# EasyEDA Pro project PLOTUS_ESP32S3_revA_project.epro

# Schematic Schematic1
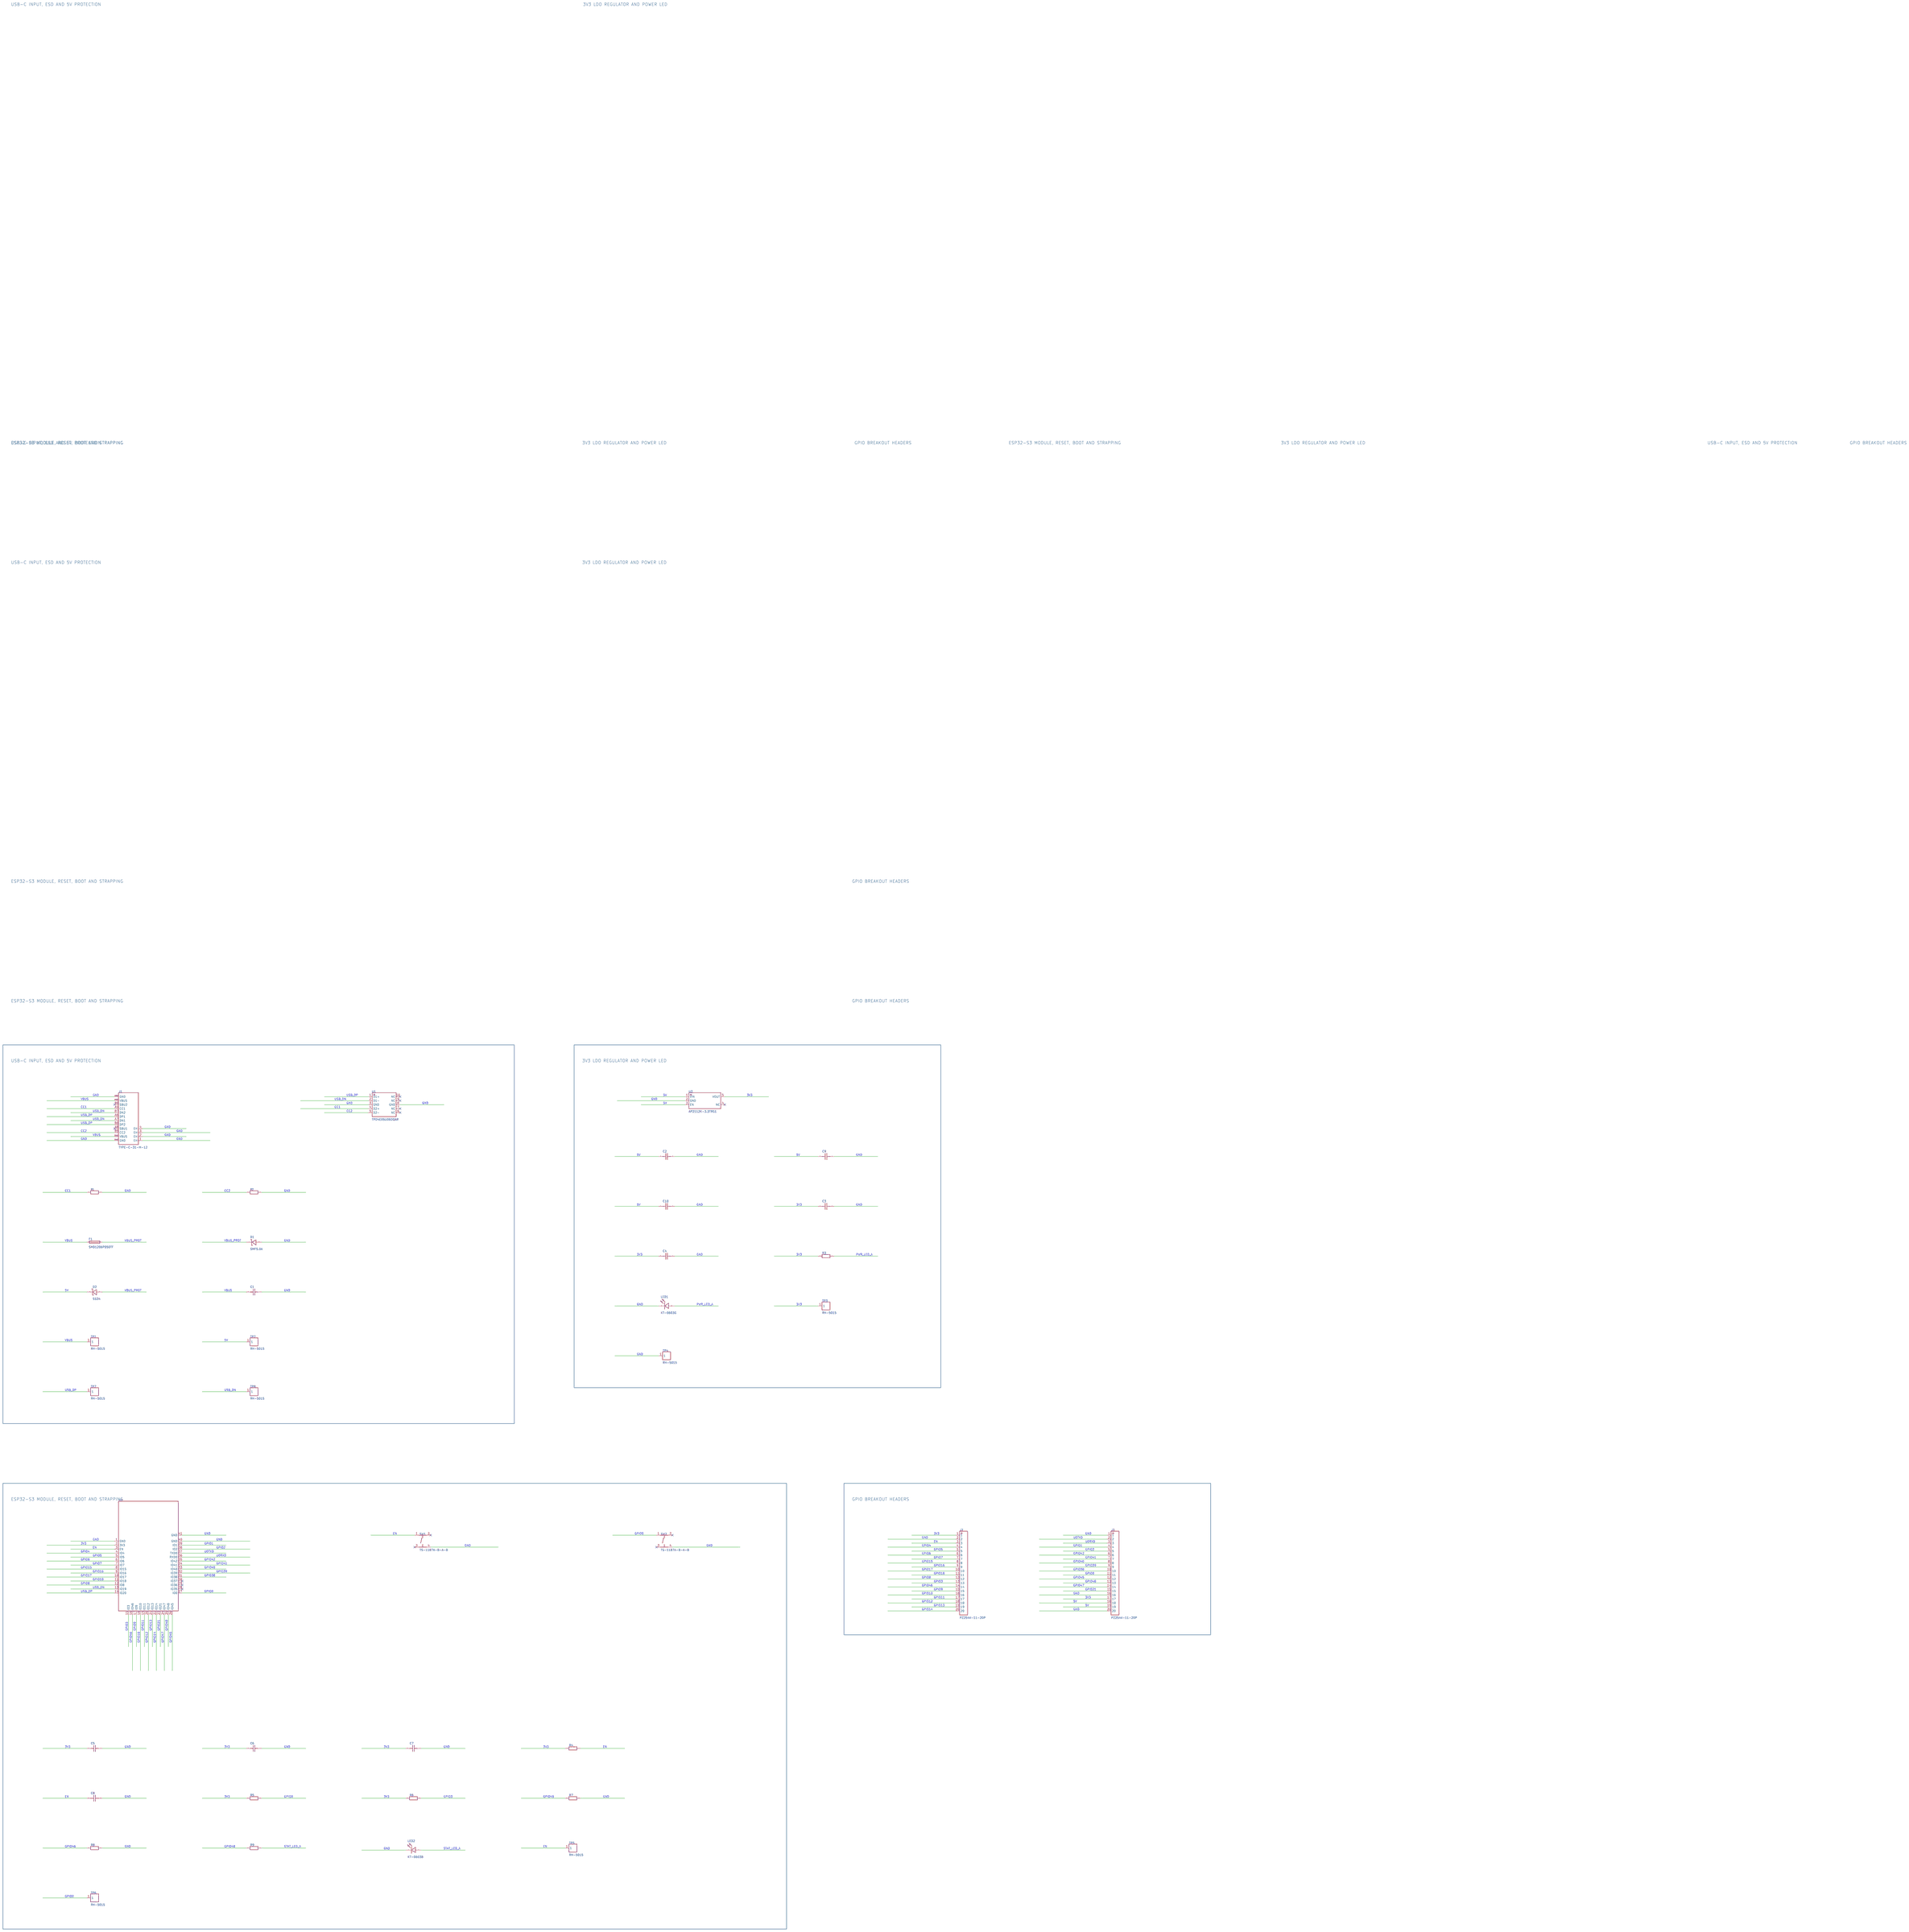
[diagram p0: schematic sheet]

## Parts
C1  100nF  [C0402]
C2  10uF  [C0603]
C3  10uF  [C0603]
C4  100nF  [C0402]
C5  10uF  [C0603]
C6  1uF  [C0402]
C7  100nF  [C0402]
C8  1uF  [C0402]
C9  1uF  [C0402]
C10  100nF  [C0402]
D1  SMF5.0A  [SOD-123_L2.8-W1.8-LS3.7-RD]
D2  SS34  [SMA_L4.3-W2.6-LS5.2-RD]
F1  SMD1206P050TF  [F1206]
J1  TYPE-C-31-M-12  [USB-C_SMD-TYPE-C-31-M-12_1]
J2  PZ254V-11-20P  [HDR-TH_20P-P2.54-V-M-4]
J3  PZ254V-11-20P  [HDR-TH_20P-P2.54-V-M-4]
LED1  KT-0603G  [LED0603-RD]
LED2  KT-0603B  [LED0603-RD]
R1  5.1kΩ  [R0402]
R2  5.1kΩ  [R0402]
R3  1kΩ  [R0402]
R4  10kΩ  [R0402]
R5  10kΩ  [R0402]
R6  10kΩ  [R0402]
R7  10kΩ  [R0402]
R8  10kΩ  [R0402]
R9  1kΩ  [R0402]
SW1  TS-1187A-B-A-B  [SW-SMD_4P-L5.1-W5.1-P3.70-LS6.5-TL_H1.5]
SW2  TS-1187A-B-A-B  [SW-SMD_4P-L5.1-W5.1-P3.70-LS6.5-TL_H1.5]
TP1  RH-5015  [SMD_RH-5015]
TP2  RH-5015  [SMD_RH-5015]
TP3  RH-5015  [SMD_RH-5015]
TP4  RH-5015  [SMD_RH-5015]
TP5  RH-5015  [SMD_RH-5015]
TP6  RH-5015  [SMD_RH-5015]
TP7  RH-5015  [SMD_RH-5015]
TP8  RH-5015  [SMD_RH-5015]
U1  TPD4E05U06DQAR  [USON-10_L2.5-W1.0-P0.50-BL]
U2  AP2112K-3.3TRG1  [SOT-25-5_L2.9-W1.6-P0.95-LS2.8-BL]
U3  2.4GHz  [WIRELM-SMD_ESP32-S3-WROOM-1]

## Library data of the parts
C1 C4 C7 C10 = CL05B104KO5NNNC: Capacitance:100nF Tolerance:±10% Tolerance:±10% Voltage Rating:16V Temperature Coefficient:X7R; LCSC Part Name: 100nF ±10% 16V; Supplier Part: CL05B104KO5NNNC.1; Manufacturer: SAMSUNG(三星); Supplier Footprint: 0402; JLCPCB Part Class: Basic Part; Datasheet: https://item.szlcsc.com/datasheet/CL05B104KO5NNNC/1877.html; Supplier: LCSC; Tolerance: ±10%; Voltage Rating: 16V; Temperature Coefficient: X7R
C2 C3 C5 = CL10A106KP8NNNC: Capacitance:10uF Tolerance:±10% Tolerance:±10% Voltage Rating:10V Temperature Coefficient:X5R; LCSC Part Name: 10uF ±10% 10V; Supplier Part: CL10A106KP8NNNC.1; Manufacturer: SAMSUNG(三星); Supplier Footprint: 0603; JLCPCB Part Class: Basic Part; Datasheet: https://item.szlcsc.com/datasheet/CL10A106KP8NNNC/20411.html; Supplier: LCSC; Tolerance: ±10%; Voltage Rating: 10V; Temperature Coefficient: X5R
C6 C8 C9 = CL05A105KA5NQNC: Capacitance:1uF Tolerance:±10% Tolerance:±10% Voltage Rating:25V Temperature Coefficient:X5R; LCSC Part Name: 1uF ±10% 25V; Supplier Part: CL05A105KA5NQNC.1; Manufacturer: SAMSUNG(三星); Supplier Footprint: 0402; JLCPCB Part Class: Basic Part; Datasheet: https://item.szlcsc.com/datasheet/CL05A105KA5NQNC/53938.html; Supplier: LCSC; Tolerance: ±10%; Voltage Rating: 25V; Temperature Coefficient: X5R
D1 = SMF5.0A: Reverse Stand-Off Voltage (Vrwm):5V Maximum Clamping Voltage:9.2V Peak Pulse Current (Ipp)@10/1000us:21.7A Breakdown Voltage:6.4V Type:TVS; Supplier Part: SMF5.0A.1; Supplier Footprint: SOD-123; JLCPCB Part Class: Extended Part; Datasheet: https://atta.szlcsc.com/upload/public/pdf/source/20180528/C132591_2E6627FA8E0A601785D44BCCBB8E552F.pdf; Supplier: LCSC; Reverse Stand-Off Voltage (Vrwm): 5V; Maximum Clamping Voltage: 9.2V; Peak Pulse Current (Ipp)@10/1000us: 21.7A; Breakdown Voltage: 6.4V; Type: TVS
D2 = SS34_C8678: Diode Configuration:Standalone Voltage - Forward(Vf@If):550mV@3A Voltage - DC Reverse(Vr):40V Current - Rectified:3A Reverse Leakage Current (Ir):500uA@40V Operating Junction Temperature Range:-55℃~+125℃ Operating Junction Temperature Range:-55℃~+125℃ Non; LCSC Part Name: 电压:40V 电流:3A; Supplier Part: SS34_C8678.1; Manufacturer: MDD(辰达半导体); Supplier Footprint: SMA(DO-214AC); JLCPCB Part Class: Basic Part; Datasheet: https://item.szlcsc.com/datasheet/SS34/9178.html; Supplier: LCSC; Diode Configuration: Standalone; Voltage - Forward(Vf@If): 550mV@3A; Voltage - DC Reverse(Vr): 40V; Current - Rectified: 3A; Reverse Leakage Current (Ir): 500uA@40V; Operating Junction Temperature Range: -55℃~+125℃; Non-Repetitive Peak Forward Surge Current: 80A
F1 = SMD1206P050TF: Operating Voltage (Max):6V Current Rating (Max):100A Hold Current:500mA Trip Current:1A; LCSC Part Name: 6V 500mA 1206自恢复; Supplier Part: SMD1206P050TF_C146251.1; Supplier Footprint: 1206; JLCPCB Part Class: Extended Part; Datasheet: https://atta.szlcsc.com/upload/public/pdf/source/20190516/C393936_420B0FABA34AF599CC1FFF27153B6079.pdf; Supplier: LCSC; Operating Voltage (Max): 6V; Current Rating (Max): 100A; Hold Current: 500mA; Trip Current: 1A
J1 = TYPE-C-31-M-12: Connector Type:Type-C Protocol Standard:- Gender:Female Mounting Type:Surface Mount, Right Angle Number of Contacts:16P Number of Ports:1 Current Rating-Power:5A Voltage Rating:20V Connect-Disconnect Life:10,000 cycles Length:7.35mm Operating Temperature:; LCSC Part Name: Type-C 母 卧贴; Supplier Part: TYPE-C-31-M-12.1; Manufacturer: 韩国韩荣; Supplier Footprint: SMD; JLCPCB Part Class: Extended Part; Datasheet: https://item.szlcsc.com/datasheet/TYPE-C-31-M-12/177331.html; Supplier: LCSC; Connector Type: Type-C; Gender: Female; Mounting Type: Surface Mount, Right Angle; Number of Contacts: 16P; Number of Ports: 1; Current Rating-Power: 5A; Voltage Rating: 20V; Connect-Disconnect Life: 10,000 cycles; Length: 7.35mm; Operating Temperature: -30℃~+80℃
J2 J3 = PZ254V-11-20P: Pin Structure:1x20P Pitch:2.54mm Circluar Pins/Square Pins:Pin Header Mounting Type:Through Hole Number of Rows:1 Number of Pins:20P Current Rating:3A Length of Mating Pin:6.1mm Insulation Height:2.5mm Length of End Connection Pin:3mm Contact Material:Bra; LCSC Part Name: 1x20P 间距:2.54mm 方针 直插; Supplier Part: PZ254V-11-20P.1; Manufacturer: XFCN(兴飞); Supplier Footprint: 插件,P=2.54mm; JLCPCB Part Class: Extended Part; Datasheet: https://item.szlcsc.com/datasheet/PZ254V-11-20P/24163072.html; Supplier: LCSC; Pin Structure: 1x20P; Pitch: 2.54mm; Circluar Pins/Square Pins: Pin Header; Mounting Type: Through Hole; Number of Rows: 1; Number of Pins: 20P; Current Rating: 3A; Length of Mating Pin: 6.1mm; Insulation Height: 2.5mm; Length of End Connection Pin: 3mm; Contact Material: Brass; Operating Temperature: -40℃~+105℃; Color: Black
LED1 = KT-0603G: Lamp Holder Type:1.6mm x 0.8mm square LED Illumination Color:Emerald Green Voltage - Forward(Vf):3.1V Voltage - Forward(Vf):3.1V Power(Watts):100mW Forward Current:5mA Wavelength - Dominant:513nm~528nm Wavelength - Dominant:513nm~528nm Peak Wavelength:525; LCSC Part Name: 0603 翠绿 高亮; Supplier Part: 0603 Green 509-620mcd.1; Manufacturer: KENTO; Supplier Footprint: 0603; JLCPCB Part Class: Extended Part; Datasheet: https://item.szlcsc.com/datasheet/KT-0603G/13258.html; Supplier: LCSC; Lamp Holder Type: 1.6mm x 0.8mm square LED; Illumination Color: Emerald Green; Voltage - Forward(Vf): 3.1V; Power(Watts): 100mW; Forward Current: 5mA; Wavelength - Dominant: 513nm~528nm; Peak Wavelength: 525nm; Diode Configuration: Discrete Diode; Lens Color: Water Clear; Luminous Intensity: 430mcd; Viewing Angle: 120°; Operating Temperature: -40℃~+85℃
LED2 = KT-0603B: Lamp Holder Type:1.6mm x 0.8mm square LED Illumination Color:Blue Voltage - Forward(Vf):3.1V Voltage - Forward(Vf):3.1V Power(Watts):100mW Forward Current:5mA Wavelength - Dominant:460nm~475nm Wavelength - Dominant:460nm~475nm Peak Wavelength:469nm Peak W; LCSC Part Name: 0603 蓝灯 高亮; Supplier Part: Blue light 0603.1; Manufacturer: KENTO; Supplier Footprint: 0603; JLCPCB Part Class: Extended Part; Datasheet: https://item.szlcsc.com/datasheet/KT-0603B/2661.html; Supplier: LCSC; Lamp Holder Type: 1.6mm x 0.8mm square LED; Illumination Color: Blue; Voltage - Forward(Vf): 3.1V; Power(Watts): 100mW; Forward Current: 5mA; Wavelength - Dominant: 460nm~475nm; Peak Wavelength: 469nm; Diode Configuration: Discrete Diode; Lens Color: Water Clear; Luminous Intensity: 175mcd; Viewing Angle: 120°; Operating Temperature: -40℃~+85℃
R1 R2 = 0402WGF5101TCE: Type:Thick Film Resistor Resistance:5.1kΩ Tolerance:±1% Tolerance:±1% Power(Watts):62.5mW Voltage-Supply(Max):50V Temperature Coefficient:±100ppm/℃ Temperature Coefficient:±100ppm/℃ Operating Temperature:-55℃~+155℃ Operating Temperature:-55℃~+155℃; LCSC Part Name: 厚膜电阻 5.1kΩ ±1%; Supplier Part: 0402WGF5101TCE.1; Manufacturer: UNI-ROYAL(厚声); Supplier Footprint: 0402; JLCPCB Part Class: Basic Part; Datasheet: https://item.szlcsc.com/datasheet/0402WGF5101TCE/26648.html; Supplier: LCSC; Type: Thick Film Resistor; Tolerance: ±1%; Power(Watts): 62.5mW; Voltage-Supply(Max): 50V; Temperature Coefficient: ±100ppm/℃; Operating Temperature: -55℃~+155℃
R3 R9 = 0402WGF1001TCE: Type:Thick Film Resistor Resistance:1kΩ Tolerance:±1% Tolerance:±1% Power(Watts):62.5mW Voltage-Supply(Max):50V Temperature Coefficient:±100ppm/℃ Temperature Coefficient:±100ppm/℃ Operating Temperature:-55℃~+155℃ Operating Temperature:-55℃~+155℃; LCSC Part Name: 厚膜电阻 1kΩ ±1%; Supplier Part: 0402WGF1001TCE.1; Manufacturer: UNI-ROYAL(厚声); Supplier Footprint: 0402; JLCPCB Part Class: Basic Part; Datasheet: https://item.szlcsc.com/datasheet/0402WGF1001TCE/12256.html; Supplier: LCSC; Type: Thick Film Resistor; Tolerance: ±1%; Power(Watts): 62.5mW; Voltage-Supply(Max): 50V; Temperature Coefficient: ±100ppm/℃; Operating Temperature: -55℃~+155℃
R4-R8 = 0402WGF1002TCE: Type:Thick Film Resistor Resistance:10kΩ Tolerance:±1% Tolerance:±1% Power(Watts):62.5mW Voltage-Supply(Max):50V Temperature Coefficient:±100ppm/℃ Temperature Coefficient:±100ppm/℃ Operating Temperature:-55℃~+155℃ Operating Temperature:-55℃~+155℃; LCSC Part Name: 厚膜电阻 10kΩ ±1%; Supplier Part: 0402WGF1002TCE.1; Manufacturer: UNI-ROYAL(厚声); Supplier Footprint: 0402; JLCPCB Part Class: Basic Part; Datasheet: https://item.szlcsc.com/datasheet/0402WGF1002TCE/26487.html; Supplier: LCSC; Type: Thick Film Resistor; Tolerance: ±1%; Power(Watts): 62.5mW; Voltage-Supply(Max): 50V; Temperature Coefficient: ±100ppm/℃; Operating Temperature: -55℃~+155℃
SW1 SW2 = TS-1187A-B-A-B: Circuit:SPST Actuator Style:Round Button Operating Force:1.6N Mounting Type:Surface Mount,Vertical Length:5.1mm Width:5.1mm Switch Height:1.5mm with Bracket:Without Bracket Contact Current:50mA Voltage Rating:12V Actuator/Cap Color:Gold With Lamp:No Life:; LCSC Part Name: 5.1*5.1*1.5mm 立贴 轻触开关; Supplier Part: TS-1187A-B-A-B.1; Manufacturer: XKB Connection(中国星坤); Supplier Footprint: SMD-4P,5.1x5.1mm; JLCPCB Part Class: Basic Part; Datasheet: https://item.szlcsc.com/datasheet/TS-1187A-B-A-B/299976.html; Supplier: LCSC; Circuit: SPST; Actuator Style: Round Button; Operating Force: 1.6N; Mounting Type: Surface Mount,Vertical; Length: 5.1mm; Width: 5.1mm; Switch Height: 1.5mm; with Bracket: Without Bracket; Contact Current: 50mA; Voltage Rating: 12V; Actuator/Cap Color: Gold; With Lamp: No; Life: 100,000 cycles; Operating Temperature: -30℃~+85℃
TP1-TP8 = RH-5015: Connector Type:Ferrite Ring (SMD) Plastic Color:Non-Plastic Board Space (Diameter φ/ Length x Width):2.67mmx1.02mm; LCSC Part Name: PCB电路板测试点/测试针; Supplier Part: RH-5015.1; Manufacturer: 荣和; JLCPCB Part Class: Extended Part; Datasheet: https://item.szlcsc.com/datasheet/RH-5015/5885634.html; Supplier: LCSC; Connector Type: Ferrite Ring (SMD); Plastic Color: Non-Plastic; Board Space (Diameter φ/ Length x Width): 2.67mmx1.02mm
U1 = TPD4E05U06DQAR: Supplier Part: TPD4E05U06DQAR.1; Supplier Footprint: USON-10; JLCPCB Part Class: Extended Part; Supplier: LCSC
U2 = AP2112K-3.3TRG1: Output Configuration:Positive Voltage - Supply:6V Output Voltage:3.3V Output Voltage:3.3V Output Current:600mA Power Supply Rejection Ratio (PSRR):65dB@(1kHz) Voltage Dropout:250mV@(600mA) standby current:55uA Noise:50uVrms Features:Enable control；Short C; LCSC Part Name: 3.3V 600mA 6V; Supplier Part: AP2112K-3.3TRG1.1; Manufacturer: DIODES(美台); Supplier Footprint: SOT-25-5; JLCPCB Part Class: Extended Part; Datasheet: https://item.szlcsc.com/datasheet/AP2112K-3.3TRG1/52131.html; Supplier: LCSC; Output Configuration: Positive; Voltage - Supply: 6V; Output Voltage: 3.3V; Output Current: 600mA; Power Supply Rejection Ratio (PSRR): 65dB@(1kHz); Voltage Dropout: 250mV@(600mA); standby current: 55uA; Noise: 50uVrms; Features: Enable control；Short Circuit Protection；Output discharge；Over Current Protection；Thermal shutdown; Operating Temperature: -40℃~+85℃@(Ta); Output Type: Fixed; Number of Outputs: 1
U3 = ESP32-S3-WROOM-1-N16R8: Utilized IC / Part:ESP32-S3R8 Interface Type:I2C；GPIO；UART；SPI；USB；I2S Frequency:2.4GHz Antenna Type:On-board PCB Antenna Output Power:20.5dBm Output Power:20.5dBm Voltage - Supply:3V~3.6V Voltage - Supply:3V~3.6V Receive  Current:95mA Send  Current:355mA; LCSC Part Name: 不带固件 通用型Wi-Fi+低功耗蓝牙MCU模组; Supplier Part: ESP32-S3-WROOM-1(N16R8).1; Manufacturer: ESPRESSIF(乐鑫); Supplier Footprint: SMD,25.5x18mm; JLCPCB Part Class: Extended Part; Datasheet: https://item.szlcsc.com/datasheet/ESP32-S3-WROOM-1-N16R8/3198300.html; Supplier: LCSC; Utilized IC / Part: ESP32-S3R8; Interface Type: I2C；GPIO；UART；SPI；USB；I2S; Antenna Type: On-board PCB Antenna; Output Power: 20.5dBm; Voltage - Supply: 3V~3.6V; Receive  Current: 95mA; Send  Current: 355mA; Sensitivity: -103.5dBm; Operating Temperature: -40℃~+65℃

## Nets
3V3: C3.1 C4.1 C5.1 C6.1 C7.1 J2.1 J3.17 R3.1 R4.1 R5.1 R6.1 TP3.1 U2.5(VOUT) U3.2(3V3)
5V: C2.1 C9.1 C10.1 D2.1(K) J3.18 J3.19 TP2.1 U2.1(VIN) U2.3(EN)
GND: C1.2 C2.2 C3.2 C4.2 C5.2 C6.2 C7.2 C8.2 C9.2 C10.2 D1.2(A) J1.1(EH) J1.2(EH) J1.3(EH) J1.4(EH) J1.A1B12(GND) J1.B1A12(GND) J2.2 J3.1 J3.16 J3.20 LED1.1(K) LED2.1(K) R1.2 R2.2 R7.2 R8.2 SW1.4(D) SW2.4(D) TP4.1 U1.3(GND) U1.8(GND) U2.2(GND) U3.1(GND) U3.40(GND) U3.41(GND)
VBUS: C1.1 F1.1 J1.A4B9(VBUS) J1.B4A9(VBUS) TP1.1
VBUS_PROT: D1.1(K) D2.2(A) F1.2
CC1: J1.A5(CC1) R1.1 U1.4(D2+)
CC2: J1.B5(CC2) R2.1 U1.5(D2-)
EN: C8.1 J2.3 R4.2 SW1.1(A) TP5.1 U3.3(EN)
GPIO0: J3.11 R5.2 SW2.1(A) TP6.1 U3.27(IO0)
GPIO1: J3.4 U3.39(IO1)
GPIO2: J3.5 U3.38(IO2)
GPIO3: J2.13 R6.2 U3.15(IO3)
GPIO4: J2.4 U3.4(IO4)
GPIO5: J2.5 U3.5(IO5)
GPIO6: J2.6 U3.6(IO6)
GPIO7: J2.7 U3.7(IO7)
GPIO8: J2.12 U3.12(IO8)
GPIO9: J2.15 U3.17(IO9)
GPIO10: J2.16 U3.18(IO10)
GPIO11: J2.17 U3.19(IO11)
GPIO12: J2.18 U3.20(IO12)
GPIO13: J2.19 U3.21(IO13)
GPIO14: J2.20 U3.22(IO14)
GPIO15: J2.8 U3.8(IO15)
GPIO16: J2.9 U3.9(IO16)
GPIO17: J2.10 U3.10(IO17)
GPIO18: J2.11 U3.11(IO18)
GPIO21: J3.15 U3.23(IO21)
GPIO38: J3.10 U3.31(IO38)
GPIO39: J3.9 U3.32(IO39)
GPIO40: J3.8 U3.33(IO40)
GPIO41: J3.7 U3.34(IO41)
GPIO42: J3.6 U3.35(IO42)
GPIO45: J3.12 R7.1 U3.26(IO45)
GPIO46: J2.14 R8.1 U3.16(IO46)
GPIO47: J3.14 U3.24(IO47)
GPIO48: J3.13 R9.1 U3.25(IO48)
PWR_LED_A: LED1.2(A) R3.2
STAT_LED_A: LED2.2(A) R9.2
U0RXD: J3.3 U3.36(RXD0)
U0TXD: J3.2 U3.37(TXD0)
USB_DN: J1.A7(DN1) J1.B7(DN2) TP8.1 U1.2(D1-) U3.13(IO19)
USB_DP: J1.A6(DP1) J1.B6(DP2) TP7.1 U1.1(D1+) U3.14(IO20)

Not connected (* = marked no-connect by the designer): J1 A8(SBU1)* B8(SBU2)*; SW1 2(B)* 3(C)*; SW2 2(B)* 3(C)*; U1 6(NC)* 7(NC)* 9(NC)* 10(NC)*; U2 4(NC)*; U3 28(IO35)* 29(IO36)* 30(IO37)*

## Notes on the sheet
- USB-C INPUT, ESD AND 5V PROTECTION
- 3V3 LDO REGULATOR AND POWER LED
- ESP32-S3 MODULE, RESET, BOOT AND STRAPPING
- ESP32-S3 MODULE, RESET, BOOT AND STRAPPING
- USB-C INPUT, ESD AND 5V PROTECTION
- 3V3 LDO REGULATOR AND POWER LED
- GPIO BREAKOUT HEADERS
- ESP32-S3 MODULE, RESET, BOOT AND STRAPPING
- 3V3 LDO REGULATOR AND POWER LED
- USB-C INPUT, ESD AND 5V PROTECTION
- GPIO BREAKOUT HEADERS
- USB-C INPUT, ESD AND 5V PROTECTION
- 3V3 LDO REGULATOR AND POWER LED
- ESP32-S3 MODULE, RESET, BOOT AND STRAPPING
- GPIO BREAKOUT HEADERS
- ESP32-S3 MODULE, RESET, BOOT AND STRAPPING
- GPIO BREAKOUT HEADERS
- USB-C INPUT, ESD AND 5V PROTECTION
- 3V3 LDO REGULATOR AND POWER LED
- ESP32-S3 MODULE, RESET, BOOT AND STRAPPING
- GPIO BREAKOUT HEADERS

# Board PCB1
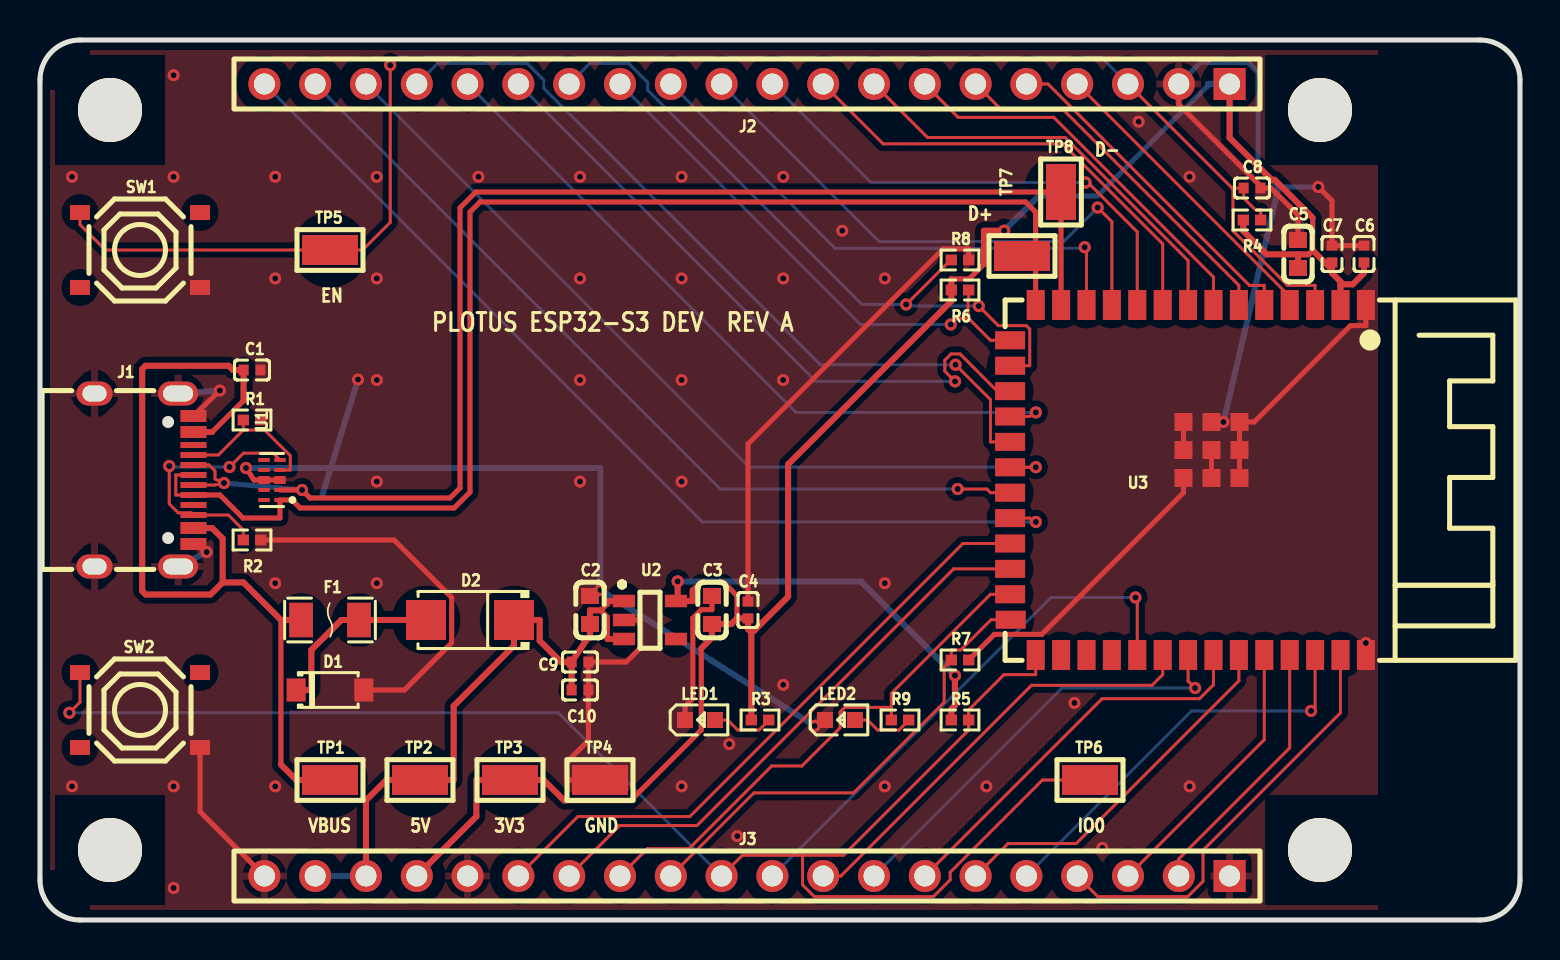
[diagram p1: board, top side]
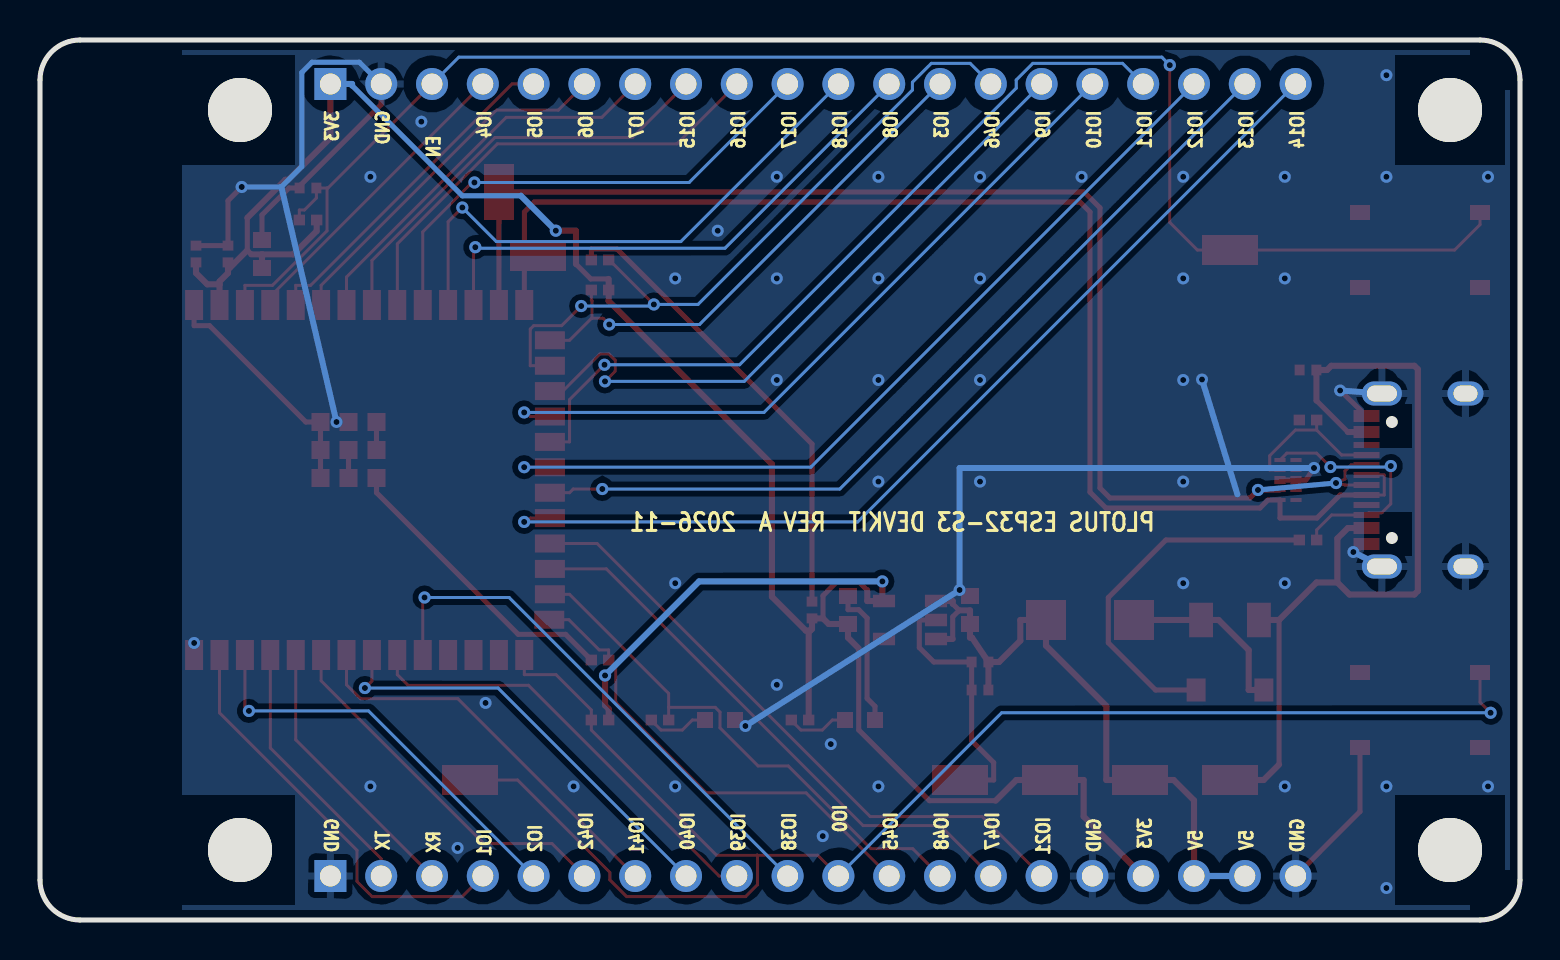
[diagram p2: board, bottom side, seen from below]

Outline 74 x 44 mm; copper layers: Top Layer, Bottom Layer. Coordinates in mm from the lower left corner of the outline.
Outline path: 0,42 0,2 arc(0.59,0.59) 2,0 72,0 arc(73.41,0.59) 74,2 74,42 arc(73.41,43.41) 72,44 2,44 arc(0.59,43.41) 0,42
Stack: Top Layer 0.035mm / Dielectric1 1.51mm FR4 er 4.5 / Bottom Layer 0.035mm

## Design rules (mm)
spacing copperThickness1oz (default): track to track 0.102, other pairs 0.152 to 0.3
spacing copperThickness2oz: track to track 0.203, other pairs 0.152 to 0.3
track width copperThickness1oz (default): min 0.15, default 0.15, max 2.54
track width copperThickness2oz: min 0.203, default 0.254, max 2.54
differential pair differentialPair (default): width min 0.127, default 0.254, max 2.54; gap min 0.152, default 0.152

## Placement (name value [footprint] x y rotation side)
C1  100nF  [C0402]  10.6 27.5 0 top
C2  10uF  [C0603]  27.5 15.5 90 top
C3  10uF  [C0603]  33.6 15.5 90 top
C4  100nF  [C0402]  35.4 15.5 90 top
C5  10uF  [C0603]  62.9 33.3 90 top
C6  1uF  [C0402]  66.2 33.3 90 top
C7  100nF  [C0402]  64.6 33.3 90 top
C8  1uF  [C0402]  60.6 36.6 0 top
C9  1uF  [C0402]  27 12.9 0 top
C10  100nF  [C0402]  27 11.5 0 top
D1  SMF5.0A  [SOD-123_L2.8-W1.8-LS3.7-RD]  14.5 11.5 0 top
D2  SS34  [SMA_L4.3-W2.6-LS5.2-RD]  21.5 15 180 top
F1  SMD1206P050TF  [F1206]  14.5 15 0 top
J1  TYPE-C-31-M-12  [USB-C_SMD-TYPE-C-31-M-12_1]  5.2 22 270 top
J2  PZ254V-11-20P  [HDR-TH_20P-P2.54-V-M-4]  35.35 41.8 180 top
J3  PZ254V-11-20P  [HDR-TH_20P-P2.54-V-M-4]  35.35 2.2 180 top
LED1  KT-0603G  [LED0603-RD]  33 10 0 top
LED2  KT-0603B  [LED0603-RD]  40 10 0 top
NOREF  -  [Pad_e170]  3.5 40.5 0 top
NOREF#2  -  [Pad_e172]  64 40.5 0 top
NOREF#3  -  [Pad_e171]  64 3.5 0 top
NOREF#4  -  [Pad_e169]  3.5 3.5 0 top
R1  5.1kΩ  [R0402]  10.6 25 0 top
R2  5.1kΩ  [R0402]  10.6 19 0 top
R3  1kΩ  [R0402]  36 10 0 top
R4  10kΩ  [R0402]  60.6 35 0 top
R5  10kΩ  [R0402]  46 10 0 top
R6  10kΩ  [R0402]  46 31.5 0 top
R7  10kΩ  [R0402]  46 13 0 top
R8  10kΩ  [R0402]  46 33 0 top
R9  1kΩ  [R0402]  43 10 0 top
SW1  TS-1187A-B-A-B  [SW-SMD_4P-L5.1-W5.1-P3.70-LS6.5-TL_H1.5]  5 33.5 0 top
SW2  TS-1187A-B-A-B  [SW-SMD_4P-L5.1-W5.1-P3.70-LS6.5-TL_H1.5]  5 10.5 0 top
TP1  RH-5015  [SMD_RH-5015]  14.5 7 0 top
TP2  RH-5015  [SMD_RH-5015]  19 7 0 top
TP3  RH-5015  [SMD_RH-5015]  23.5 7 0 top
TP4  RH-5015  [SMD_RH-5015]  28 7 0 top
TP5  RH-5015  [SMD_RH-5015]  14.5 33.5 0 top
TP6  RH-5015  [SMD_RH-5015]  52.5 7 0 top
TP7  RH-5015  [SMD_RH-5015]  49.1 33.2 0 top
TP8  RH-5015  [SMD_RH-5015]  51.05 36.4 90 top
U1  TPD4E05U06DQAR  [USON-10_L2.5-W1.0-P0.50-BL]  11.6 22 90 top
U2  AP2112K-3.3TRG1  [SOT-25-5_L2.9-W1.6-P0.95-LS2.8-BL]  30.5 15 270 top
U3  2.4GHz  [WIRELM-SMD_ESP32-S3-WROOM-1]  57.4 22 270 top

## Footprints (pads in the part's own frame, mm; a bottom-side part is the same pattern mirrored in y, then rotated)
C0402
  rect 0.5x0.54 smd: 1(-0.42,0) 2(0.42,0)
C0603
  rect 0.8x0.9 smd: 1(-0.7,0) 2(0.7,0)
F1206
  rect 1.19x1.728 smd: 1(-1.445,0) 2(1.445,0)
HDR-TH_20P-P2.54-V-M-4
  rect 1.6x1.6 hole 1.05: 1(-24.13,0)
  round 1.6 hole 1.05: 2(-21.59,0) 3(-19.05,0) 4(-16.51,0) 5(-13.97,0) 6(-11.43,0) 7(-8.89,0) 8(-6.35,0) 9(-3.81,0) 10(-1.27,0) 11(1.27,0) 12(3.81,0) 13(6.35,0) 14(8.89,0) 15(11.43,0) 16(13.97,0) 17(16.51,0) 18(19.05,0) 19(21.59,0) 20(24.13,0)
LED0603-RD
  rect 0.8x0.8 smd: 1(-0.749,0) 2(0.749,0)
Pad_e169
  round 3.2 hole 3.2: MH1(0,0)
Pad_e170
  round 3.2 hole 3.2: MH2(0,0)
Pad_e171
  round 3.2 hole 3.2: MH3(0,0)
Pad_e172
  round 3.2 hole 3.2: MH4(0,0)
R0402
  rect 0.566x0.54 smd: 1(-0.433,0) 2(0.433,0)
SMA_L4.3-W2.6-LS5.2-RD
  rect 2x2 smd: 1(-2.2,0) 2(2.2,0)
SMD_RH-5015
  rect 2.8x1.5 smd: 1(0,0)
SOD-123_L2.8-W1.8-LS3.7-RD
  rect 0.95x1.15 smd: 1(-1.692,0) 2(1.692,0)
SOT-25-5_L2.9-W1.6-P0.95-LS2.8-BL
  rect 0.623x1.105 smd: 1(-0.95,-1.3) 2(-0.001,-1.3) 3(0.95,-1.3) 4(0.95,1.3) 5(-0.95,1.3)
SW-SMD_4P-L5.1-W5.1-P3.70-LS6.5-TL_H1.5
  rect 1x0.75 smd: 1(-3,1.875) 2(3,1.875) 3(-3,-1.875) 4(3,-1.875)
USB-C_SMD-TYPE-C-31-M-12_1
  oval 1.2x2 hole 0.8x1.5: 1(4.325,1.706) 4(-4.325,1.706)
  oval 1.2x1.8 hole 0.8x1.2: 2(4.325,-2.474) 3(-4.325,-2.474)
  custom 0.6x1.3 smd: A1B12(-3.2,2.474) A4B9(-2.4,2.474) B1A12(3.2,2.474) B4A9(2.401,2.474)
  rect 0.3x1.3 smd: A5(-1.25,2.474) A6(-0.25,2.474) A7(0.25,2.474) A8(1.25,2.474) B5(1.75,2.474) B6(0.75,2.474) B7(-0.75,2.474) B8(-1.75,2.474)
USON-10_L2.5-W1.0-P0.50-BL
  rect 0.2x0.565 smd: 1(-1,-0.4) 2(-0.5,-0.4) 4(0.5,-0.4) 5(1,-0.4) 6(1,0.4) 7(0.5,0.4) 9(-0.5,0.4) 10(-1,0.4)
  rect 0.4x0.565 smd: 3(0,-0.4) 8(0,0.4)
WIRELM-SMD_ESP32-S3-WROOM-1
  rect 1.5x0.9 smd: 1(-8.75,8.895) 2(-8.75,7.625) 3(-8.75,6.355) 4(-8.75,5.085) 5(-8.75,3.815) 6(-8.75,2.545) 7(-8.75,1.275) 8(-8.75,0.005) 9(-8.75,-1.265) 10(-8.75,-2.535) 11(-8.75,-3.805) 12(-8.75,-5.075) 13(-8.75,-6.345) 14(-8.75,-7.615) 27(8.75,-7.615) 28(8.75,-6.345) 29(8.75,-5.075) 30(8.75,-3.805) 31(8.75,-2.535) 32(8.75,-1.265) 33(8.75,0.005) 34(8.75,1.275) 35(8.75,2.545) 36(8.75,3.815) 37(8.75,5.085) 38(8.75,6.355) 39(8.75,7.625) 40(8.75,8.895)
  rect 0.9x1.5 smd: 15(-6.985,-8.895) 16(-5.715,-8.895) 17(-4.445,-8.895) 18(-3.175,-8.895) 19(-1.905,-8.895) 20(-0.635,-8.895) 21(0.635,-8.895) 22(1.905,-8.895) 23(3.175,-8.895) 24(4.445,-8.895) 25(5.715,-8.895) 26(6.985,-8.865)
  rect 0.9x0.9 smd: 41(-2.9,2.575) 41(-2.9,1.175) 41(-2.9,-0.225) 41(-1.5,2.575) 41(-1.5,1.175) 41(-1.5,-0.225) 41(-0.1,2.575) 41(-0.1,1.175) 41(-0.1,-0.225)

## Nets
As in the schematic.

Pads without a net: J1 A8 B8; NOREF MH2; NOREF#2 MH4; NOREF#3 MH3; NOREF#4 MH1; SW1 2 3; SW2 2 3; U1 6 7 9 10; U2 4; U3 28 29 30

## Via types
v1: diameter 0.6, hole 0.3, Top Layer to Bottom Layer, 48 vias
v2: diameter 0.61, hole 0.305, Top Layer to Bottom Layer, 26 vias

## Routing (per net, layer and track width the routed paths; a pad name or vN(x,y) marks a point on that pad's centre or on a via; arc(x,y) is an arc through that point)
3V3: length 117.9
  Top Layer w0.254: 32.63,16.49 33.03,16.88 34.18,16.88 34.85,16.22 34.85,15.08 ; 63.43,33.28 63.63,33.48 63.63,35.11 ; 33.06,13.58 33.06,9.5 29.53,5.97 26.22,5.97 ; 45.57,32.05 46.46,32.05 47.2,32.8
  Top Layer w0.305: v2(31.88,16.93) 31.88,16.19 32.12,15.95 ; 33.06,13.58 33.6,14.12 C3.1 34.57,14.8 34.85,15.08 C4.1 35.4,14.55 35.48,14.47 35.57,14.47 ; C7.1 64.6,32.61 ; 64.6,32.61 64.51,32.61 63.63,33.48 ; 64.6,32.61 64.6,32.35 65.02,31.92 65.02,31.78 ; R4.1 60.17,34.45 61.33,33.28 62.9,33.28 ; 62.9,33.28 C5.1 ; 62.9,33.28 63.43,33.28 ; 31.8,15.95 32.12,15.95 ; 32.12,15.95 32.63,15.95 32.63,16.49 ; 65.02,30.75 65.02,31.78 ; 65.02,31.78 65.64,31.78 66.2,32.35 C6.1 ; 26.22,5.97 25.18,7 TP3.1 21.82,7 21.82,5.18 J3.17 ; 63.63,35.11 61.73,37.01 61.58,37.01 59.48,39.11 J2.1 ; 35.57,14.47 35.71,14.47 37.4,16.16 37.4,22.78 45.57,30.95 R6.1 45.57,32.05 ; 35.57,14.47 R3.1 ; v2(45.75,12.22) 45.75,10.73 45.57,10.55 R5.1 ; 47.2,32.8 47.2,34.47 48.21,34.47
  Bottom Layer w0.254: 49.95,36.21 52.88,36.21 58.4,41.72
  Bottom Layer w0.305: 49.95,36.21 v2(48.21,34.47) ; J2.1 58.4,41.8 58.4,41.72 ; v2(31.88,16.93) 41.04,16.93 v2(45.75,12.22)
5V: length 33.4
  Top Layer w0.254: 28.36,15.81 28.04,15.48 28.36,15.16 28.36,14.05
  Top Layer w0.305: 29.2,15.95 28.36,15.95 28.36,15.81 ; C9.1 26.05,12.9 24.98,13.97 24.98,15 D2.1 23.7,13.72 20.68,10.7 20.68,7 TP2.1 17.32,7 16.3,5.98 J3.18 ; C9.1 27.4,14.12 ; C9.1 C10.1 ; 27.4,14.12 27.5,14.12 C2.1 27.5,15.48 28.04,15.48 ; 29.2,14.05 28.36,14.05
  Bottom Layer w0.305: J3.18 J3.19
GND: length 193.4
  Top Layer w0.25: J1.A1B12 v1(9,26.47) ; C2.2 v1(28.02,16.5) ; U3.41 v1(59.18,24.9) ; 39.25,10 v1(38.73,9.7) ; J1.B1A12 v1(8.33,18.4) ; 66.29,13.25 v1(66.29,13.85)
  Top Layer w0.254: TP4.1 26.32,7 26.32,7.87 27.42,8.97 C10.2 C9.2 29.31,12.9 30.04,13.62 30.04,15 U2.2 ; 8,8.63 8,5.42 J3.20 ; C4.2 35.4,23.8 45.15,33.55 46.43,33.55 46.43,33 ; 66.29,30.75 66.29,29.72 65.52,29.72 60.71,24.9 60.34,24.9 ; U3.41 U3.41 ; C3.2 33.6,15.52 33.07,15.52 32.64,15.09 32.64,11.08 32.25,10.68 32.25,10 ; v2(10.3,22.6) 10.7,22 U1.8 U1.3 ; 11.03,19 17.7,19 20.58,16.12 20.58,13.86 18.22,11.5 D1.2 ; 60.34,24.9 59.97,24.53 59.97,22.1 ; 60.34,24.9 59.97,24.9 ; C6.2 C7.2 64.6,35.97 v2(63.91,36.65) ; J2.2 56.94,40.78 61.02,36.7 C8.2 61.55,36.6 62.9,35.25 C5.2 ; U3.41 57.18,21.37 50.09,14.28 47.72,14.28 46.43,13 ; U3.41 U3.41
  Bottom Layer w0.254: J2.2 58.03,42.89 60.4,42.89 60.91,42.38 60.91,37.67 61.93,36.65 v2(63.91,36.65)
  Bottom Layer w0.3: 14.54,22.6 14.13,21.28 ; 14.54,22.6 v2(10.3,22.6) ; 14.54,22.6 v1(15.9,27.03) ; 14.54,22.6 28.02,22.6 v1(28.02,16.5) v1(38.73,9.7) ; v1(59.18,24.9) 61.93,36.65 ; v1(8.33,18.4) J1.1 ; v1(9,26.47) J1.4
  vias: v1(1.6,37.16) v1(1.6,6.68) v1(6.68,42.24) v1(6.68,37.16) v1(6.68,6.68) v1(6.68,1.6) v1(11.76,37.16) v1(11.76,32.08) v1(11.76,16.84) v1(11.76,6.68) v1(16.84,37.16) v1(16.84,32.08) v1(16.84,27) v1(16.84,21.92) v1(16.84,16.84) v1(21.92,37.16) v1(27,37.16) v1(27,32.08) v1(27,27) v1(27,21.92) v1(32.08,37.16) v1(32.08,32.08) v1(32.08,27) v1(32.08,21.92) v1(32.08,6.68) v1(34.46,8.8) v1(34.86,4.19) v1(37.16,37.16) v1(37.16,32.08) v1(37.16,27) v1(37.16,11.76) v1(40.11,34.46) v1(42.24,32.08) v1(42.24,16.84) v1(42.24,6.68) v1(47.32,6.68) v1(51.72,10.85) v1(53.12,3.6) v1(54.93,39.92) v1(57.48,37.16) v1(57.48,6.68)
VBUS: length 43.9
  Top Layer w0.254: 12.05,7.77 12.05,15 ; 8.61,24.4 10.18,25.97
  Top Layer w0.305: 9.13,16.88 8.53,16.27 5.29,16.27 5.11,16.45 5.11,27.54 5.28,27.71 9.44,27.71 9.65,27.5 C1.1 10.18,25.97 ; 9.13,16.88 9.13,19.08 8.61,19.6 7.67,19.6 ; 9.13,16.88 10.17,16.88 12.05,15 F1.1 ; J1.A4B9 8.61,24.4 ; TP1.1 12.82,7 12.05,7.77
VBUS_PROT: length 9.1
  Top Layer w0.305: 12.81,11.5 13.57,11.5 13.57,13.5 15.07,15 19.3,15
CC1: length 7.6
  Top Layer w0.15: 10.17,24.5 11.23,24.5 12.51,23.22 12.51,22.5 U1.4 ; 10.17,24.5 10.17,25 ; 10.17,24.5 8.92,23.25 7.67,23.25
CC2: length 12.6
  Top Layer w0.15: U1.5 11.66,23.34 10.17,23.34 v2(9.48,22.65) ; v2(6.46,22.7) 6.46,20.81 6.91,20.36 7.57,20.36 7.67,20.25 9.42,20.25 10.17,19.5 10.17,19
  Bottom Layer w0.15: v2(9.48,22.65) 6.51,22.65 v2(6.46,22.7)
EN: length 81.1
  Top Layer w0.15: J2.3 59.6,36.6 59.65,36.6 ; 59.65,36.6 C8.1 60.18,36.1 60.78,35.5 61.03,35.5 61.03,35 ; 59.65,36.6 59.65,34.46 62.38,31.73 63.75,31.73 63.75,30.75 ; 2,35.37 2,34.77 3.27,33.5 TP5.1 16.13,33.5 17.51,34.88 v2(17.51,42.74)
  Bottom Layer w0.15: J2.3 53.06,43.14 17.91,43.14 v2(17.51,42.74)
GPIO0: length 78.4
  Top Layer w0.15: 38.13,3.24 38.13,1.76 38.72,1.17 44.67,1.17 45.51,2.01 45.51,2.39 50.12,7 TP6.1 ; 38.13,3.24 35.12,3.24 J3.11 ; 38.13,3.24 40.17,3.24 46.43,9.5 46.43,10.5 48.2,12.27 49.78,12.27 49.78,13.25 ; v2(1.47,10.36) 2,10.89 SW2.1
  Bottom Layer w0.15: v2(1.47,10.36) 25.92,10.36 J3.11
GPIO1: length 21.2
  Top Layer w0.15: 65.02,13.25 65.02,10.36 58.15,3.48 58.15,1.93 57.39,1.17 52.89,1.17 J3.4
GPIO2: length 20.5
  Top Layer w0.15: 63.75,13.25 63.75,10.66 v2(63.55,10.45)
  Bottom Layer w0.15: v2(63.55,10.45) 57.57,10.45 J3.5
GPIO3: length 26.5
  Top Layer w0.15: 46.4,30.09 46.4,30.97 46.43,31 46.43,31.5 ; 46.4,30.09 46.42,30.09 47.52,28.98 48.51,28.98 ; 46.4,30.09 45.85,30.09 v2(45.54,29.78)
  Bottom Layer w0.15: v2(45.54,29.78) 41.02,29.78 J2.13
GPIO4: length 15.5
  Top Layer w0.15: J2.4 62.48,31.18 62.48,30.75
GPIO5: length 17
  Top Layer w0.15: J2.5 50.4,41.8 60.47,31.73 61.21,31.73 61.21,30.75
GPIO6: length 18.3
  Top Layer w0.15: J2.6 48.08,40.5 51.18,40.5 59.94,31.73 59.94,30.75
GPIO7: length 19.8
  Top Layer w0.15: 58.67,30.75 58.67,32.15 50.69,40.13 45.91,40.13 J2.7
GPIO8: length 27
  Top Layer w0.15: v2(52.24,33.64) 52.32,33.55 52.32,30.75
  Bottom Layer w0.15: v2(52.24,33.64) 52.18,33.59 39.75,33.59 J2.12
GPIO9: length 33.4
  Top Layer w0.15: v2(45.75,26.93) 45.24,27.44 45.24,27.99 45.55,28.3 46,28.3 47.86,26.44 48.51,26.44
  Bottom Layer w0.15: v2(45.75,26.93) 38.79,26.93 J2.15
GPIO10: length 36.6
  Top Layer w0.15: 48.51,25.17 49.49,25.17 49.69,25.38 v2(49.79,25.38)
  Bottom Layer w0.15: v2(49.79,25.38) 37.8,25.38 J2.16
GPIO11: length 39.4
  Top Layer w0.15: v2(45.78,27.76) 47.52,26.02 47.52,23.9 48.51,23.9
  Bottom Layer w0.15: v2(45.78,27.76) 39.02,27.76 25.19,41.59 25.19,42 24.36,42.83 19.87,42.83 J2.17
GPIO12: length 42.7
  Top Layer w0.15: v2(49.79,22.64) 49.49,22.64 49.49,22.63 48.51,22.63
  Bottom Layer w0.15: J2.18 35.46,22.64 v2(49.79,22.64)
GPIO13: length 43.2
  Top Layer w0.15: 48.51,21.36 47.52,21.36 47.34,21.55 v2(45.88,21.55)
  Bottom Layer w0.15: v2(45.88,21.55) 34.01,21.55 J2.19
GPIO14: length 49
  Top Layer w0.15: v2(49.79,19.9) 49.68,19.9 49.49,20.09 48.51,20.09
  Bottom Layer w0.15: v2(49.79,19.9) 33.12,19.9 J2.20
GPIO15: length 21.6
  Top Layer w0.15: 57.4,30.75 57.4,32.97 51.25,39.13 44.37,39.13 J2.8
GPIO16: length 23.3
  Top Layer w0.15: 56.13,30.75 56.13,33.81 51.13,38.81 42.15,38.81 J2.9
GPIO17: length 25
  Top Layer w0.15: v2(52.28,36.88) 52.4,36.88 54.86,34.4 54.86,30.75
  Bottom Layer w0.15: J2.10 41.54,36.88 v2(52.28,36.88)
GPIO18: length 27.9
  Top Layer w0.15: 53.59,30.75 53.59,34.91 v2(52.88,35.62)
  Bottom Layer w0.15: J2.11 41.96,33.92 51.18,33.92 v2(52.88,35.62)
GPIO21: length 31.5
  Top Layer w0.15: 48.51,18.82 46.14,18.82 32.49,5.17 26.89,5.17 J3.15
GPIO38: length 26.8
  Top Layer w0.15: 54.86,13.25 54.86,16.03 v2(54.77,16.13)
  Bottom Layer w0.15: v2(54.77,16.13) 50.55,16.13 J3.10
GPIO39: length 22.1
  Top Layer w0.15: J3.9 40.04,2.2 49.58,11.73 55.6,11.73 56.13,12.27 56.13,13.25
GPIO40: length 21.7
  Top Layer w0.15: v2(57.75,11.6) 57.4,11.95 57.4,13.25
  Bottom Layer w0.15: J3.8 51.1,11.6 v2(57.75,11.6)
GPIO41: length 19.9
  Top Layer w0.15: J3.7 53.1,11.06 57.98,11.06 58.67,11.76 58.67,13.25
GPIO42: length 18.5
  Top Layer w0.15: 59.94,13.25 59.94,11.96 51.81,3.82 48.4,3.82 J3.6
GPIO45: length 23.6
  Top Layer w0.15: 48.53,15.01 47.55,15.01 46.04,13.5 45.57,13.5 R7.1 45.21,12.64 45.21,10.89 40.68,6.36 35.69,6.36 J3.12
GPIO46: length 35.2
  Top Layer w0.15: R8.1 45.53,33 v2(43.31,30.78) ; v2(46.94,30.7) 47.92,29.72 49.31,29.72 49.49,29.55 49.49,27.71 48.51,27.71
  Bottom Layer w0.15: v2(46.94,30.7) 43.39,30.7 v2(43.31,30.78) 41.1,30.78 30.38,41.5 30.38,41.89 29.43,42.83 27.49,42.83 J2.14
GPIO47: length 28.4
  Top Layer w0.15: J3.14 28.98,4.72 32.85,4.72 45.68,17.55 48.51,17.55
GPIO48: length 26.8
  Top Layer w0.15: 42.57,10.63 40.24,10.63 40,10.4 40,9.61 38.09,7.7 36.59,7.7 32.45,3.57 30.37,3.57 J3.13 ; 42.57,10.63 42.57,11.33 47.52,16.28 48.51,16.28 ; 42.57,10.63 R9.1
PWR_LED_A: length 3.1
  Top Layer w0.15: LED1.2 34.38,10 34.88,9.5 35.95,9.5 36.43,9.98 36.43,10
STAT_LED_A: length 3.1
  Top Layer w0.15: 43.43,10 43.43,9.98 42.95,9.5 41.88,9.5 41.38,10 LED2.2
U0RXD: length 13.9
  Top Layer w0.15: J3.3 61.21,9.01 61.21,13.25
U0TXD: length 13.3
  Top Layer w0.15: 62.48,13.25 62.48,8.6 56.94,3.06 J3.2
USB_DN: length 67
  Top Layer w0.15: 7.67,22.75 8.45,22.75 8.75,22.45 8.75,22.05 v2(9.2,21.85) 8.75,21.75 J1.A7
  Top Layer w0.254: U1.2 v2(13.1,21.5) 13.5,21.1 20.5,21.1 21,21.6 21,35.61 21.79,36.4 51.05,36.4 51.05,30.75
  Bottom Layer w0.254: v2(9.2,21.85) v2(13.1,21.5)
USB_DP: length 65.8
  Top Layer w0.15: J1.A6 6.79,22.25 6.79,21.25 J1.B6
  Top Layer w0.254: 49.78,30.75 49.78,35.4 49.28,35.9 22,35.9 21.5,35.4 21.5,21.39 20.71,20.6 13,20.6 12.6,21 U1.1 12,20.1 10.15,20.1 9,21.25 J1.B6

## Copper pours and planes (outline as drawn; the poured copper is in the pictures)
GND on Top Layer: 33.36,10 45.7,10 45.7,3.45 33.36,3.45
GND on Top Layer: 53.68,40.55 59.27,40.55 59.27,34.92 53.68,34.92
GND on Top Layer: 36.02,29.71 47.59,29.71 47.59,10.28 36.02,10.28
GND on Top Layer: 49.41,32.67 66.9,32.67 66.9,6.25 49.41,6.25
GND on Top Layer: 9.58,35.47 49.35,35.47 49.35,2.85 9.58,2.85
GND on Top Layer: 41.97,11.36 52.87,11.36 52.87,2.85 41.97,2.85
GND on Top Layer: 5.56,27.26 9.73,27.26 9.73,24.94 5.56,24.94
GND on Top Layer: 52.12,12.27 60.84,12.27 60.84,2.85 52.12,2.85
GND on Top Layer: 36.73,17.18 47.52,17.18 47.52,8.08 36.73,8.08
GND on Top Layer: 5.56,19.04 8.68,19.04 8.68,16.73 5.56,16.73
GND on Top Layer: 0.5,43.5 66.9,43.5 66.9,0.5 0.5,0.5
GND on Top Layer: 61.48,37.75 66.9,37.75 66.9,32.24 61.48,32.24
GND on Top Layer: 29.71,9.44 35.91,9.44 35.91,5.55 29.71,5.55
GND on Bottom Layer: 0.5,43.5 66.9,43.5 66.9,0.5 0.5,0.5
GND on Bottom Layer: 33.36,40.55 41.39,40.55 41.39,33.96 33.36,33.96

## Text on the board
Bottom Silkscreen Layer: IO14 | GND | IO13 | 5V | IO12 | IO11 | 3V3 | IO10 | IO9 | IO21 | IO46 | IO47 | IO3 | IO48 | IO8 | IO45 | IO18 | IO0 | IO17 | IO38 | IO16 | IO39 | IO15 | IO40 | IO7 | IO41 | IO6 | IO42 | IO5 | IO2 | IO4 | IO1 | EN | RX | TX | PLOTUS ESP32-S3 DEVKIT  REV A  2026-11
Top Silkscreen Layer: VBUS | EN | 5V | 3V3 | GND | D+ | IO0 | D- | PLOTUS ESP32-S3 DEV  REV A
